# Altium project DTCP v2.0.PrjPcb (part 2 of 2)

## Sheet Boost 5V.SchDoc
size A; SheetNumber: 12; SheetTotal: 12
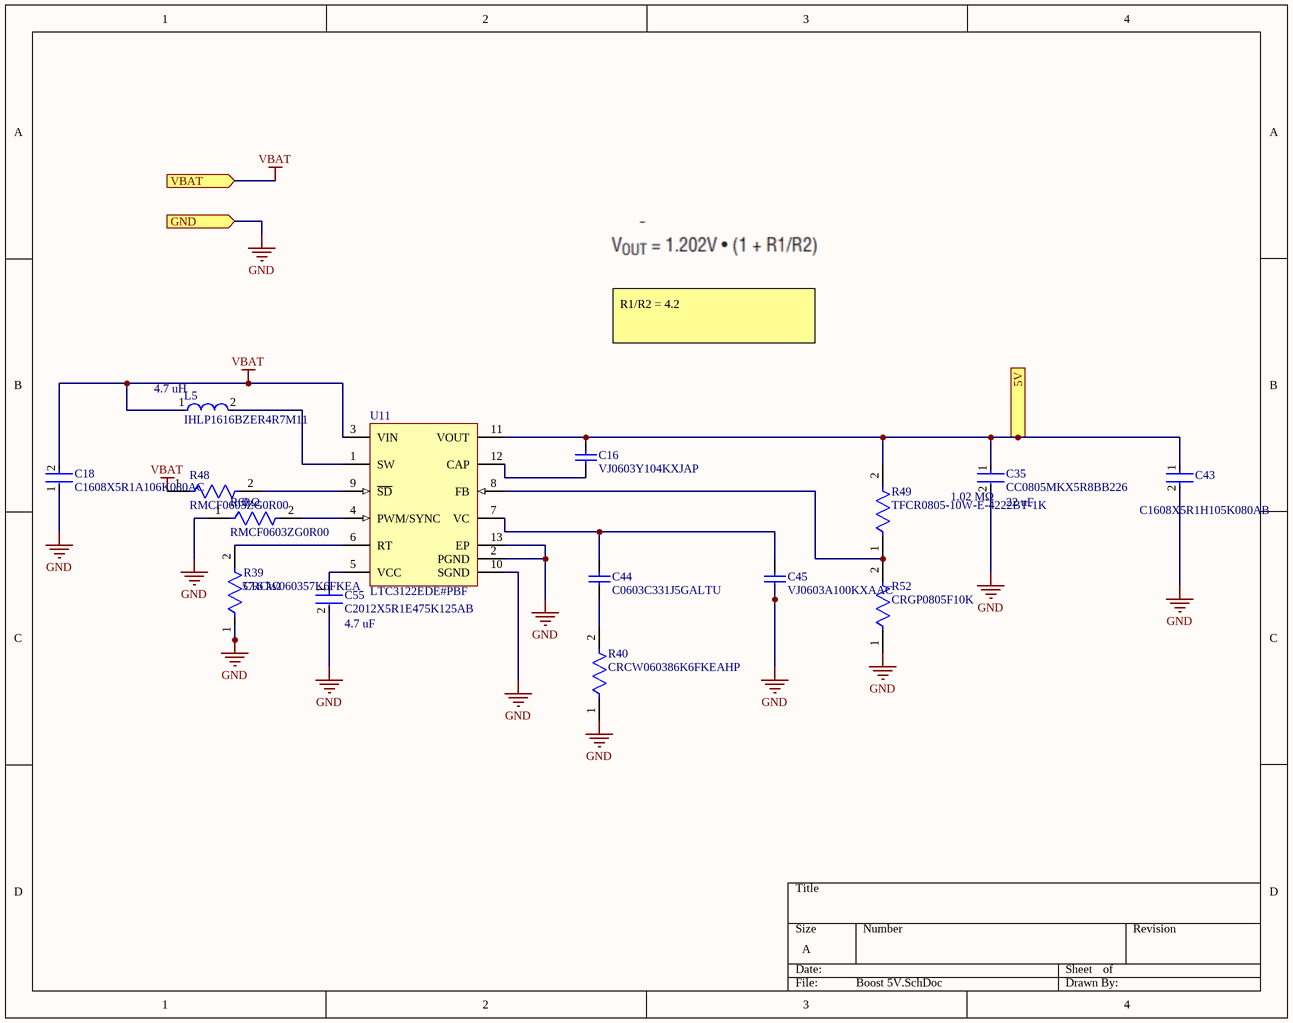
[diagram p10: Boost 5V.SchDoc]

### Parts
C16  VJ0603Y104KXJAP  [CAPC1608X92X38NL15T08]
C18  C1608X5R1A106K080AC  [FP-C1608-080-0_1-MFG]
C35  CC0805MKX5R8BB226  [FP-CC0805-0_2-1_45-IPC_C]
C43  C1608X5R1H105K080AB  [FP-C1608-080-0_1-IPC_B]
C44  C0603C331J5GALTU  [CAPC1608X87X35NL15T15]
C45  VJ0603A100KXAAC  [CAPC1608X92X38ML12T08]
C55  C2012X5R1E475K125AB  [FP-C2012-125-0_2-MFG]
L5  IHLP1616BZER4R7M11  [FP-IHLP-1616BZ-FP_1_8545x-MFG]
R39  CRCW060357K6FKEA  [FP-CRCW0603-e3-MFG]
R40  CRCW060386K6FKEAHP  [FP-CRCW0603-HPe3-MFG]
R48  RMCF0603ZG0R00  [FP-RMCF0603-IPC_B]
R49  TFCR0805-10W-E-4222BT-1K  [FP-TFCR0805-IPC_A]
R52  CRGP0805F10K  [FP-CRGP0805-IPC_C]
R60  RMCF0603ZG0R00  [FP-RMCF0603-IPC_B]
U11  LTC3122EDE#PBF  [LT-DE-UE-12_V]

### Ports
5V (out), GND (in), VBAT (in)

### Nets
5V0: C16.2 C35.1 C43.1 R49.2 U11.11(VOUT) ; port 5V
GND: C18.1 C35.2 C43.2 C45.1 C55.2 R39.1 R40.1 R52.1 R60.1 U11.2(PGND) U11.10(SGND) U11.13(EP) ; port GND
VBAT: C18.2 L5.1 R48.1 U11.3(VIN) ; port VBAT
NetC16_1: C16.1 U11.12(CAP)
NetC44_1: C44.1 R40.2
NetC44_2: C44.2 C45.2 U11.7(VC)
NetC55_1: C55.1 U11.5(VCC)
NetL5_2: L5.2 U11.1(SW)
NetR39_2: R39.2 U11.6(RT)
NetR48_2: R48.2 U11.9(~{SD})
NetR49_1: R49.1 R52.2 U11.8(FB)
NetR60_2: R60.2 U11.4(PWM/SYNC)

### Notes on the sheet
- R1/R2 = 4.2
- (near L5) 4.7 uH
- 0 Ω
- (near C35) 1.02 MΩ
- (near C35) 22 uF
- (near R39) 57.6 kΩ
- (near C55) 4.7 uF

### Library data of the parts
C16 = CMP-2006-01211-1: Manufacturer: Vitramon; Part Number: VJ0603Y104KXJAP
C18 = CMP-2000-04979-3: Multilayer Ceramic Capacitors 10μF ±10% 10V X5R SMD 0603; Capacitance: 10uF; Dielectric Material: Ceramic; Construction: Flat; Height: 0.8mm; Thickness: 0.035inch; Case Code (Metric): 1608; Radiation Hardening: No; Number of Pins: 2; Voltage Rating (DC): 10V; Depth: 0.8mm; Voltage: 10V; RoHS Compliant: Yes; Voltage Rating: 10V; Package Quantity: 1; Resistor Type: Ceramic; Termination: SMD/SMT; Lead Free: Lead Free; REACH SVHC: No SVHC; Tolerance: 10%; Mount: Surface Mount; Series: C; Packaging: Tape and Reel; Width: 0.8mm; Dielectric: X5R; Weight: 7.1E-05oz; Length: 1.6mm; Max Operating Temperature: 85°C; Case Code (Imperial): 0603; Case/Package: 0603; Min Operating Temperature: -55°C
C35 = CMP-03422-001497-1: CAP CER 22UF 25V X5R 0805; Tolerance: 20%; Max Operating Temperature: 85°C; Dielectric: X5R; Termination: SMD/SMT; Voltage Rating: 25V; Width: 0.049inch; Min Operating Temperature: -55°C; Case/Package: 0805; Lead Free: Lead Free; RoHS Compliant: Yes; Weight: 0.000194oz; Voltage Rating (DC): 25V; Capacitance: 22uF; Length: 0.079inch; Halogen Free: Halogen Free; Height: 1.25mm; Packaging: Tape and Reel; Package Quantity: 3000; Case Code (Metric): 2012; Thickness: 0.057inch; Case Code (Imperial): 0805; Mount: Surface Mount
C43 = CMP-2000-06025-2: Multilayer Ceramic Capacitors 1μF ±10% 50V X5R SMD 0603; Capacitance: 1uF; Lead Free: Lead Free; Height: 0.8mm; Mount: Surface Mount; Radiation Hardening: No; Thickness: 0.035inch; Length: 1.6mm; Max Operating Temperature: 85°C; REACH SVHC: No SVHC; Min Operating Temperature: -55°C; Construction: Flat; RoHS Compliant: Yes; Voltage Rating: 50V; Dielectric: X5R; Packaging: Tape and Reel; Termination: SMD/SMT; Voltage Rating (DC): 50V; Case Code (Imperial): 0603; Voltage: 50V; Width: 0.031inch; Weight: 7.1E-05oz; Depth: 0.8mm; Case Code (Metric): 1608; Series: C; Case/Package: 0603; Tolerance: 10%; Resistor Type: Ceramic; Number of Pins: 2; Dielectric Material: Ceramic; Package Quantity: 1
C44 = CMP-2006-03564-1: Manufacturer: Kemet; Part Number: C0603C331J5GALTU
C45 = CMP-2006-02012-1: Manufacturer: Vitramon; Part Number: VJ0603A100KXAAC
C55 = CMP-08246-004908-1: Multilayer Ceramic Capacitors 4.7μF ±10% 25V X5R SMD 0805; Capacitance: 4.7uF; Lead Free: Lead Free; Thickness: 0.057inch; Packaging: Tape and Reel; Min Operating Temperature: -55°C; RoHS Compliant: Yes; Dielectric: X5R; Weight: 0.000194oz; REACH SVHC: No SVHC; Voltage Rating (DC): 25V; Mount: Surface Mount; Resistor Type: Ceramic; Termination: SMD/SMT; Number of Pins: 2; Case Code (Imperial): 0805; Dielectric Material: Ceramic; Voltage: 25V; Voltage Rating: 25V; Case Code (Metric): 2012; Case/Package: 0805; Max Operating Temperature: 85°C; Height: 1.25mm; Tolerance: 10%; Depth: 1.25mm; Package Quantity: 1; Length: 2mm; Radiation Hardening: No; Width: 1.25mm
L5 = CMP-02424-000576-1: Fixed Inductors Commercial Low DCR Series SMT 4.7uH 1.7A 105mΩ 20%; Saturation Current: 1.75A; Test Frequency: 100kHz; Shielding: Shielded; Self Resonant Frequency: 29MHz; Core Material: Ferrite; DC Resistance (DCR): 105mR; Width: 4.06mm; Depth: 4.31mm; Height: 2mm; Inductance: 4.7uH; Case/Package: 1616; Max DC Current: 1.7A; Max Operating Temperature: 125°C; Inductance Tolerance: 20%; Current Rating: 1.7A; Package Quantity: 4000; Tolerance: 20%; Length: 4.7mm; Contact Plating: Tin; RMS Current (Irms): 1.7A; Packaging: Tape and Reel; Height - Seated (Max): 0.079inch; Military Standard: Not; Termination: SMD/SMT; Mount: Surface Mount; Number of Pins: 1616; Min Operating Temperature: -55°C; Lead Free: Lead Free; Radiation Hardening: No
R39 = CMP-2000-03475-2: RES Thick Film, 57.6kΩ, 1%, 0.1W, 100ppm/°C, 0603; Voltage Rating: 75V; Power Rating: 100mW; Resistance: 57.6kR; Case Code (Metric): 1608; Length: 1.55mm; Weight: 7.1E-05oz; Case/Package: 0603; Features: Automotive AEC-Q200; Contact Plating: Tin; Temperature Coefficient: 100ppm/°C; Number of Terminations: 2; Packaging: Tape and Reel; Package Quantity: 10; Max Power Dissipation: 100mW; Depth: 0.85mm; Height: 0.45mm; Tolerance: 1%; Radiation Hardening: No; Composition: Thick Film; Width: 0.85mm; Min Operating Temperature: -55°C; Case Code (Imperial): 0603; Termination: SMD/SMT; Number of Pins: 2; Max Operating Temperature: 155°C; Military Standard: Not
R40 = CMP-02407-006337-1: RES Thick Film, 86.6kΩ, 1%, 0.33W, 100ppm/°C, 0603; Max Power Dissipation: 250mW; Resistance: 86.6kR; Tolerance: 1%; Width: 0.033inch; Package Quantity: 5000; Composition: Thick Film; Number of Terminations: 2; Height: 0.022inch; Length: 0.063inch; Temperature Coefficient: 100ppm/°C; Packaging: Tape and Reel; Features: Automotive AEC-Q200; Lead Free: Lead Free; Case/Package: 0603
R48 R60 = CMP-26527-006412-1: 0Ω ±0 0.1W 0603 Thick Film Chip Resistor AEC-Q200 compliant; Max Power Dissipation: 100mW; Resistance: 0R; Width: 0.031inch; RoHS Compliant: Yes; Number of Terminations: 2; Case/Package: 0603; Contact Plating: Tin; Height: 0.022inch; Resistor Type: Thick Film; Mount: Surface Mount; Length: 0.061inch; Features: Automotive AEC-Q200; Series: RMCF; Max Operating Temperature: 155°C; Radiation Hardening: No; Min Operating Temperature: -55°C; Packaging: Tape and Reel
R49 = CMP-250906-237835-1: RES Thin Film,  42.2kΩ, 0.1%, 0.1W, 25ppm/°C, 0805
R52 = CMP-03211-006861-1: CRGP 0805 10K 1%; Manufacturer: TE; Power Rating: 0.33W; Voltage Rating: 150V; Value: 10KΩ; Tolerance: 0.01; Temperature Coefficient: ±100ppm/°C; Manufacturer Part Number: CRGP0805F10K; ComponentLink2URL: https://www.mouser.com/datasheet/2/418/NG_DS_9-1773463-9_A-1358566.pdf; Temperature Range Low: -55°C; Ipc Land Pattern Name: RESC200125X55; Device Class L2: Resistors; Automotive: No; Device Class L3: Chip SMD Resistors; Composition: Thick Film; Temperature Range High: +155°C; Temperature: -55°C to +155°C; Height: 0.65mm; Series: CRGP; RoHS: TRUE; Device Class L1: Passive Components; Octopart: https://octopart.com/crgp0805f10k-te+connectivity-91018782; Package: CRGP0805; Digikey Description: CRGP 0805 10K 1%; Ambient Temperature Range High: +70°C; Lead Free: Yes; ComponentLink2Description: Datasheet; Category: Res; Resistance: 10KΩ
U11 = CMP-0492-00369-1: 2.5 A Synchronous Step-Up DC/DC Converter with Output Disconnect, 12-pin SON (DE-UE-12), -40 to 125 degC, Pb-Free; Manufacturer: Linear Technology; Number of Outputs: 1; ComponentLink2URL: http://cds.linear.com/docs/en/datasheet/3122fa.pdf; ComponentLink1URL: http://www.linear.com/; Code_JEDEC: MO-229; ComponentLink2Description: Datasheet; ComponentLink1Description: Manufacturer URL; PackageReference: DE-UE-12; PackageVersion: Rev. D, 06/2010; ComponentLink3Description: Package Specification; PackageDescription: 12-Pin Plastic DFN, Body 4 x 3 mm, Pitch 0.5 mm; PartNumber: LTC3122EDE#PBF; ComponentLink3URL: http://cds.linear.com/docs/en/packaging/DFN_12_05-08-1695.pdf; Mounting Technology: Surface Mount; RoHS: TRUE; DatasheetVersion: Rev. A

## Sheet AFE.SchDoc
size A; SheetNumber: 7; SheetTotal: 12
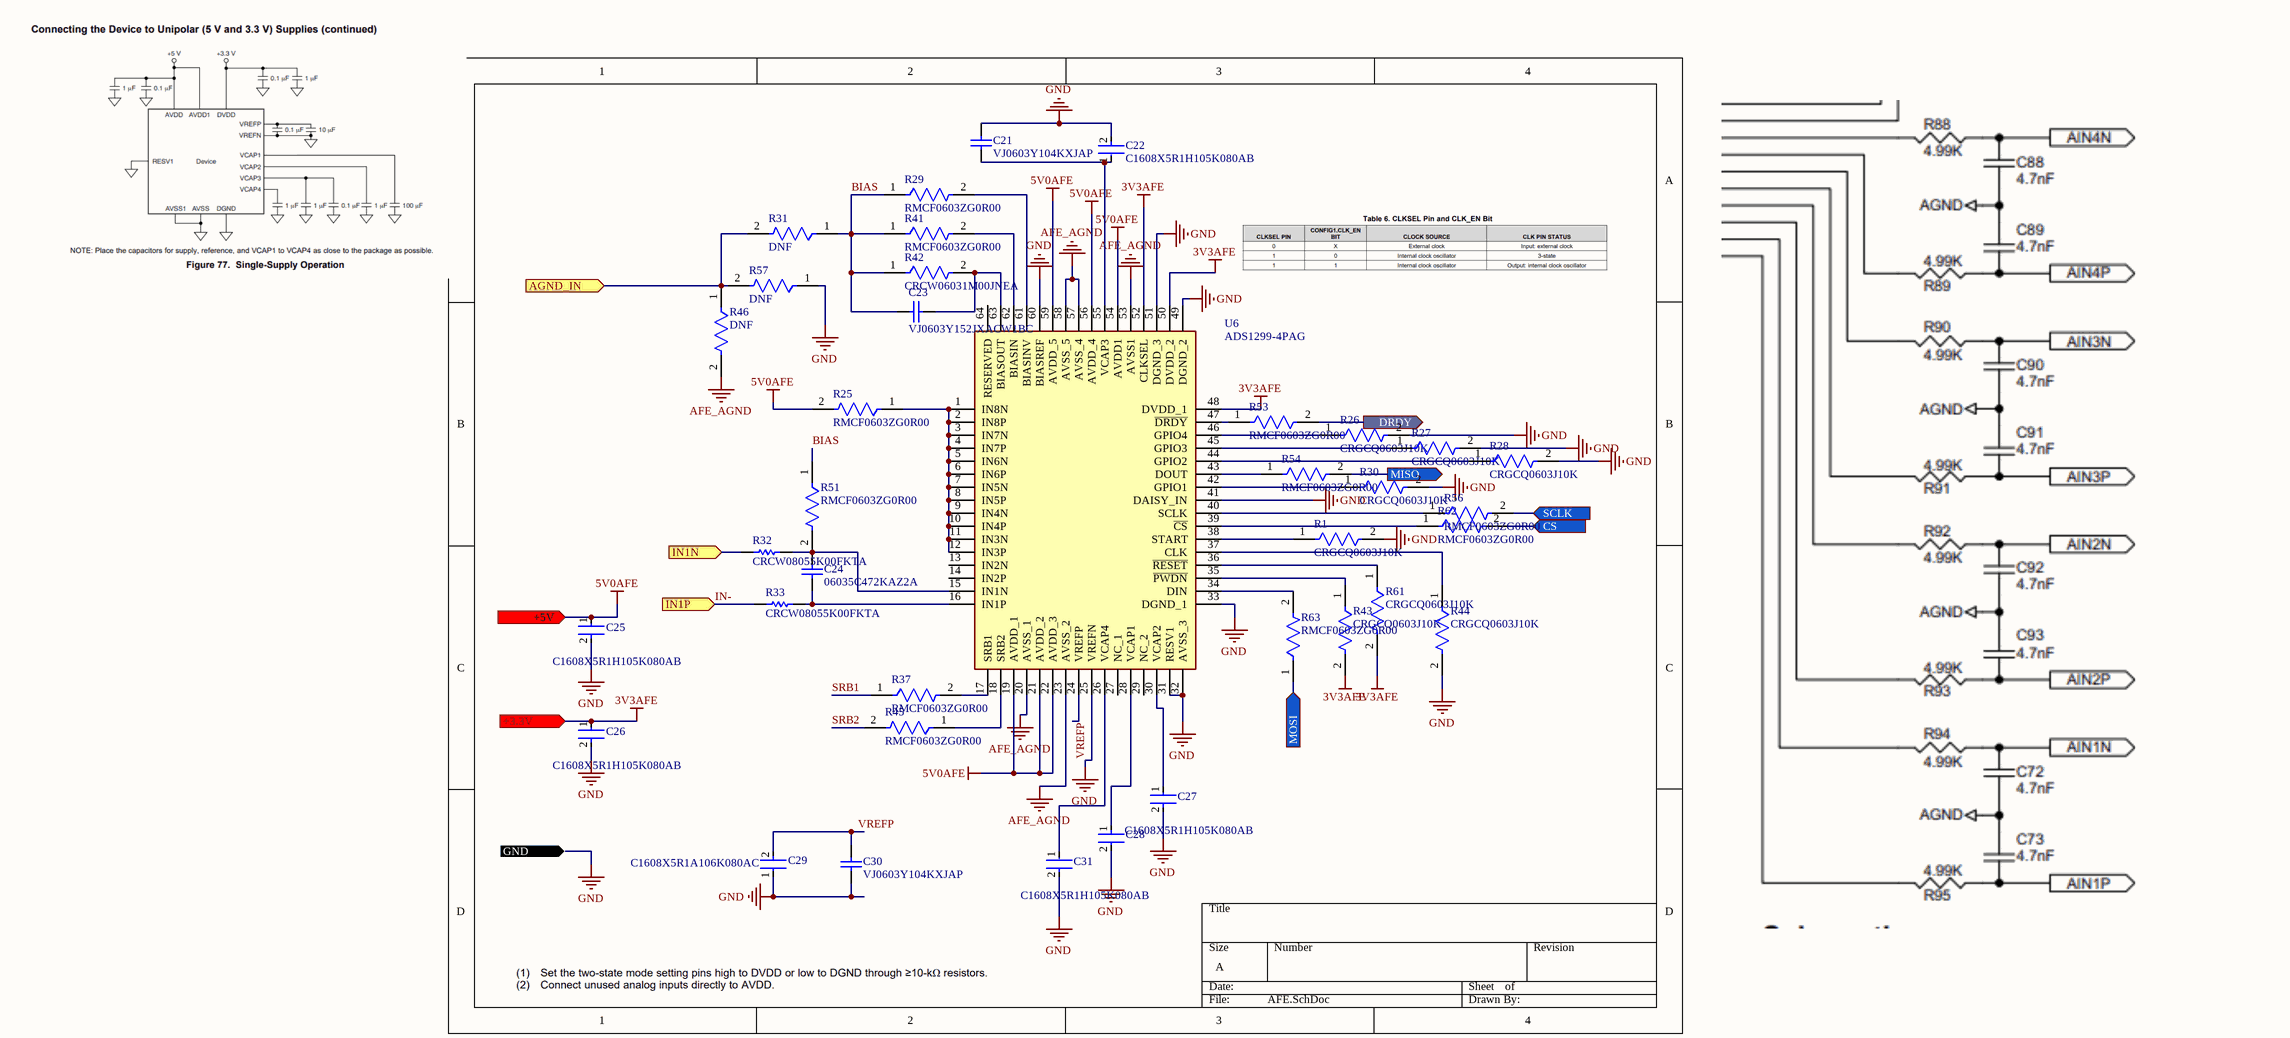
[diagram p11: AFE.SchDoc]

### Parts
C21  VJ0603Y104KXJAP  [CAPC1608X92X38NL15T08]
C22  C1608X5R1H105K080AB  [FP-C1608-080-0_1-IPC_B]
C23  VJ0603Y152JXACW1BC  [CAPC1608X95X40NL15T15]
C24  06035C472KAZ2A  [CAPC1608X90X35LL15T15]
C25  C1608X5R1H105K080AB  [FP-C1608-080-0_1-IPC_B]
C26  C1608X5R1H105K080AB  [FP-C1608-080-0_1-IPC_B]
C27  C1608X5R1H105K080AB  [FP-C1608-080-0_1-IPC_B]
C28  GRM21BR60J107ME15K  [FP-GRM21B-0_2-e0_2_0_7-IPC_B]  (value not drawn)
C29  C1608X5R1A106K080AC  [FP-C1608-080-0_1-MFG]
C30  VJ0603Y104KXJAP  [CAPC1608X92X38NL15T08]
C31  C1608X5R1H105K080AB  [FP-C1608-080-0_1-IPC_B]
R1  CRGCQ0603J10K  [FP-CRGCQ0603-IPC_C]
R25  RMCF0603ZG0R00  [FP-RMCF0603-IPC_B]
R26  CRGCQ0603J10K  [FP-CRGCQ0603-IPC_C]
R27  CRGCQ0603J10K  [FP-CRGCQ0603-IPC_C]
R28  CRGCQ0603J10K  [FP-CRGCQ0603-IPC_C]
R29  RMCF0603ZG0R00  [FP-RMCF0603-IPC_B]
R30  CRGCQ0603J10K  [FP-CRGCQ0603-IPC_C]
R31  DNF  [FP-RMCF0603-IPC_B]
R32  CRCW08055K00FKTA  [RESC2013X50X30ML20T20]
R33  CRCW08055K00FKTA  [RESC2013X50X30ML20T20]
R37  RMCF0603ZG0R00  [FP-RMCF0603-IPC_B]
R41  RMCF0603ZG0R00  [FP-RMCF0603-IPC_B]
R42  CRCW06031M00JNEA  [FP-CRCW0603-e3-IPC_B]
R43  CRGCQ0603J10K  [FP-CRGCQ0603-IPC_C]
R44  CRGCQ0603J10K  [FP-CRGCQ0603-IPC_C]
R45  RMCF0603ZG0R00  [FP-RMCF0603-IPC_B]
R46  DNF  [FP-RMCF0603-IPC_B]
R51  RMCF0603ZG0R00  [FP-RMCF0603-IPC_B]
R53  RMCF0603ZG0R00  [FP-RMCF0603-IPC_B]
R54  RMCF0603ZG0R00  [FP-RMCF0603-IPC_B]
R56  RMCF0603ZG0R00  [FP-RMCF0603-IPC_B]
R57  DNF  [FP-RMCF0603-IPC_B]
R61  CRGCQ0603J10K  [FP-CRGCQ0603-IPC_C]
R62  RMCF0603ZG0R00  [FP-RMCF0603-IPC_B]
R63  RMCF0603ZG0R00  [FP-RMCF0603-IPC_B]
U6  ADS1299-4PAG  [QFP50P1200X1200X120-64N]

### Ports
+3.3V (in), +5V (in), AGND_IN (in), CS (in), DRDY (out), GND (in), IN1N (in), IN1P (in), MISO (out), MOSI (in), SCLK (in)

### Nets
3V3AFE: C26.1 R43.2 R61.2 U6.48(DVDD_1) U6.50(DVDD_2) U6.52(CLKSEL) ; port +3.3V  [project net 3V3]
5V0AFE: C25.1 R25.2 U6.19(AVDD_1) U6.21(AVDD_2) U6.22(AVDD_3) U6.54(AVDD1) U6.56(AVDD_4) U6.59(AVDD_5) ; port +5V  [project net 5V0]
AFE_AGND: R46.2 U6.20(AVSS_1) U6.23(AVSS_2) U6.53(AVSS1) U6.57(AVSS_4) U6.58(AVSS_5)
GND: C21.2 C22.2 C25.2 C26.2 C27.2 C28.2 C29.1 C30.1 C31.2 R1.2 R26.2 R27.2 R28.2 R30.2 R44.2 R57.1 U6.25(VREFN) U6.31(RESV1) U6.32(AVSS_3) U6.33(DGND_1) U6.41(DAISY_IN) U6.49(DGND_2) U6.51(DGND_3) U6.60(BIASREF) ; port GND
BIAS: C23.1 R29.1 R31.1 R41.1 R42.1 R51.1
CS: R62.2 ; port CS
DRDY: R53.2 ; port DRDY
IN-: R33.1 ; port IN1P
PICO: R63.1 ; port MOSI
POCI: R54.2 ; port MISO
SCK: R56.2 ; port SCLK
SRB1: R37.1
SRB2: R45.2
VREFP: C29.2 C30.2 U6.24(VREFP)
NetC21_1: C21.1 C22.1 U6.55(VCAP3)
NetC23_2: C23.2 R42.2 U6.63(BIASOUT)
NetC24_1: C24.1 R32.2 R51.2 U6.15(IN1N)
NetC24_2: C24.2 R33.2 U6.16(IN1P)
NetC27_1: C27.1 U6.30(VCAP2)
NetC28_1: C28.1 U6.28(VCAP1)
NetC31_1: C31.1 U6.26(VCAP4)
NetP1_2: R32.1 ; port IN1N
NetP3_1: R31.2 R46.1 R57.2 ; port AGND_IN
NetR1_1: R1.1 U6.38(START)
NetR25_1: R25.1 U6.1(IN8N) U6.2(IN8P) U6.3(IN7N) U6.4(IN7P) U6.5(IN6N) U6.6(IN6P) U6.7(IN5N) U6.8(IN5P) U6.9(IN4N) U6.10(IN4P) U6.11(IN3N) U6.12(IN3P)
NetR26_1: R26.1 U6.46(GPIO4)
NetR27_1: R27.1 U6.45(GPIO3)
NetR28_1: R28.1 U6.44(GPIO2)
NetR29_2: R29.2 U6.61(BIASINV)
NetR30_1: R30.1 U6.42(GPIO1)
NetR37_2: R37.2 U6.17(SRB1)
NetR41_2: R41.2 U6.62(BIASIN)
NetR43_1: R43.1 U6.35(~{PWDN})
NetR44_1: R44.1 U6.37(CLK)
NetR45_1: R45.1 U6.18(SRB2)
NetR53_1: R53.1 U6.47(~{DRDY})
NetR54_1: R54.1 U6.43(DOUT)
NetR56_1: R56.1 U6.40(SCLK)
NetR61_1: R61.1 U6.36(~{RESET})
NetR62_1: R62.1 U6.39(~{CS})
NetR63_2: R63.2 U6.34(DIN)

Not connected (* = marked no-connect by the designer): U6 13(IN2N) 14(IN2P) 27(NC_1) 29(NC_2) 64(RESERVED)

### Library data of the parts
C21 C30 = CMP-2006-01211-1: Manufacturer: Vitramon; Part Number: VJ0603Y104KXJAP
C22 C25-C27 C31 = CMP-2000-06025-2: as C43 on sheet Boost 5V; Lead Free: Lead Free; Height: 0.8mm; Mount: Surface Mount; Radiation Hardening: No; Thickness: 0.035inch; Length: 1.6mm; Max Operating Temperature: 85°C; REACH SVHC: No SVHC; Min Operating Temperature: -55°C; Construction: Flat; RoHS Compliant: Yes; Voltage Rating: 50V; Dielectric: X5R; Packaging: Tape and Reel; Termination: SMD/SMT; Voltage Rating (DC): 50V; Case Code (Imperial): 0603; Voltage: 50V; Width: 0.031inch; Weight: 7.1E-05oz; Depth: 0.8mm; Case Code (Metric): 1608; Series: C; Case/Package: 0603; Tolerance: 10%; Resistor Type: Ceramic; Number of Pins: 2; Dielectric Material: Ceramic; Package Quantity: 1
C23 = CMP-2006-01561-1: Manufacturer: Vitramon; Part Number: VJ0603Y152JXACW1BC
C24 = CMP-2006-04440-1: Manufacturer: AVX Interconnect / Elco; Part Number: 06035C472KAZ2A
C28 = CMP-06035-052658-1: Chip Multilayer Ceramic Capacitors for General Purpose, 0805, 100uF, X5R, 15%, 20%, 6.3V; Voltage Rating (DC): 6.3V; Lead Free: Lead Free; Length: 2mm; Tolerance: 20%; Width: 1.25mm; Capacitance: 100uF; Dielectric: X5R; Thickness: 1.25mm
C29 = CMP-2000-04979-3: as C18 on sheet Boost 5V; Dielectric Material: Ceramic; Construction: Flat; Height: 0.8mm; Thickness: 0.035inch; Case Code (Metric): 1608; Radiation Hardening: No; Number of Pins: 2; Voltage Rating (DC): 10V; Depth: 0.8mm; Voltage: 10V; RoHS Compliant: Yes; Voltage Rating: 10V; Package Quantity: 1; Resistor Type: Ceramic; Termination: SMD/SMT; Lead Free: Lead Free; REACH SVHC: No SVHC; Tolerance: 10%; Mount: Surface Mount; Series: C; Packaging: Tape and Reel; Width: 0.8mm; Dielectric: X5R; Weight: 7.1E-05oz; Length: 1.6mm; Max Operating Temperature: 85°C; Case Code (Imperial): 0603; Case/Package: 0603; Min Operating Temperature: -55°C
R1 R26-R28 R30 R43 R44 R61 = CMP-03211-009884-1: CRGCQ 0603 10K 5%; Manufacturer: TE Connectivity; Tolerance: 0.05; Power Rating: 0.1W; Resistance: 10KΩ; Voltage Rating: 75V; Value: 10KΩ; Temperature Coefficient: ±100ppm/°C; Composition: Thick Film; ComponentLink2URL: https://www.te.com/commerce/DocumentDelivery/DDEController?Action=showdoc&DocId=Data+Sheet%7F1773204-3%7F1%7Fpdf%7FEnglish%7FENG_DS_1773204-3_1.pdf%7F4-2176339-923; Device Class L1: Passive Components; Package: CRGCQ0603; Mouser Description: Res Thick Film 0603 10K Ohm 5% 0.1W(1/10W) ±100ppm/C Pad SMD Automotive T/R; Temperature Range High: +155°C; Category: Res; Device Class L2: Resistors; Height: 0.55mm; RoHS: TRUE; Lead Free: Yes; Ipc Land Pattern Name: RESC16080X45; Temperature: -55°C to +155°C; Series: CRGCQ; Digikey Description: CRGCQ 0603 10K 5%; Octopart: https://octopart.com/crgcq0603j10k-te+connectivity-91018097; Device Class L3: Chip SMD Resistors; Ambient Temperature Range High: +70°C; ComponentLink2Description: Datasheet; Temperature Range Low: -55°C; Manufacturer Part Number: CRGCQ0603J10K
R25 R29 R31 R37 R41 R45 R46 R51 R53 R54 R56 R57 R62 R63 = CMP-26527-006412-1: as R48 on sheet Boost 5V; Width: 0.031inch; RoHS Compliant: Yes; Number of Terminations: 2; Case/Package: 0603; Contact Plating: Tin; Height: 0.022inch; Resistor Type: Thick Film; Mount: Surface Mount; Length: 0.061inch; Features: Automotive AEC-Q200; Series: RMCF; Max Operating Temperature: 155°C; Radiation Hardening: No; Min Operating Temperature: -55°C; Packaging: Tape and Reel
R32 R33 = CMP-2001-04239-1: Manufacturer: Vishay Dale; Part Number: CRCW08055K00FKTA
R42 = CMP-2000-03016-2: RES Thick Film, 1MΩ, 5%, 0.1W, 200ppm/°C, 0603; Max Power Dissipation: 100mW; Resistance: 1MR; Voltage Rating: 75V; Temperature Coefficient: 200ppm/°C; Military Standard: Not; Mount: Surface Mount; Package Quantity: 1; Number of Pins: 2; Power Rating: 100mW; Packaging: Tape and Reel; Length: 1.55mm; Width: 0.85mm; Height: 0.02inch; Min Operating Temperature: -55°C; Tolerance: 5%; Depth: 0.85mm; Composition: Thick Film; Number of Terminations: 2; Max Operating Temperature: 155°C; Termination: SMD/SMT; Case Code (Imperial): 0603; Weight: 7.1E-05oz; Case Code (Metric): 1608; Radiation Hardening: No; Contact Plating: Tin; Case/Package: 0603; Features: Automotive AEC-Q200
U6 = ADS1299-4PAG: Low-Noise, 4-Channel, 24-Bit Analog-to-Digital Converter for Biopotential Measurements; Manufacturer_Name: Texas Instruments; Geometry.Height: 1.2mm; Mouser Part Number: 595-ADS1299-4PAG; Mouser Price/Stock: https://www.mouser.co.uk/ProductDetail/Texas-Instruments/ADS1299-4PAG?qs=9lcNTSmDlCovTG3JfbaYgg%3D%3D; Manufacturer_Part_Number: ADS1299-4PAG; Datasheet Link: http://www.ti.com/lit/gpn/ads1299-4

## Nets that join several sheets
3V3: System (J2.9 R12.2), MCU (5 pins), DDS (Y1.4), LDO (C20.2 U5.1 U5.2), Switch1 (C11.2 U3.1), AFE (6 pins)
3V3DDS: System (R12.1), DDS (10 pins), Switch1 (U3.6)
5V0: System (J2.8), Boost 5V (5 pins), AFE (8 pins)
13V0: System (J2.7 R11.2), Boost 12V (5 pins), Switch2 (C47.2 U10.1)
13V0PA: System (R8.1), PA stage 2 (C36.2 C38.2 L3.2)
GND: System (44 pins), MCU (5 pins), DDS (17 pins), PA stage 1 (5 pins), PA stage 2 (13 pins), LDO (C19.2 C20.1 U5.3 U5.7), Output (L15.2 L15.5), Boost 12V (11 pins), Switch1 (C11.1 C12.1 U3.2), Switch2 (C47.1 C48.1 U10.2), Boost 5V (12 pins), AFE (24 pins)
PA1_VDD: System (R15.1), PA stage 1 (R38.2)
VBAT: System (12 pins), LDO (C19.1 U5.5 U5.6), Boost 12V (C6.2 L1.1 R4.1 U2.3), Boost 5V (C18.2 L5.1 R48.1 U11.3)
CS: System (J8.9), MCU (U1.19), AFE (R62.2)
D7: System (J1.4), MCU (U1.20), DDS (U4.25)
DDS_OUT: System (R16.2), DDS (R21.1 U4.21), PA stage 1 (C34.1)
DDS_RST: System (J1.3), MCU (U1.13), DDS (U4.22)
DDS_WCLK: System (J1.1), MCU (U1.18), DDS (U4.7)
DRDY: System (J8.6), MCU (U1.10), AFE (R53.2)
FQ_UD: System (J1.2), MCU (U1.17), DDS (U4.8)
IN-: System (P1.1), AFE (R33.1)
NetC33_2: System (R10.2), PA stage 1 (C33.2), PA stage 2 (C39.1 L4.2)
NetC40_2: System (R13.2), PA stage 2 (C40.2), Output (L15.4)
NetL14_1: System (R9.1), Output (L14.1 L15.3 L16.2)
NetL15_1: System (R17.2), Output (L15.1 L16.1 L17.2)
NetP1_2: System (P1.2), AFE (R32.1)
NetP3_1: System (P3.1), AFE (R31.2 R46.1 R57.2)
NetR8_2: System (R8.2 R11.1 R15.2), Switch2 (U10.6)
NetR14_1: MCU (U1.3), Boost 12V (R14.1), Switch2 (U10.3)
NetU1_8: MCU (U1.8), DDS (Y1.1), Switch1 (U3.3)
NRST: System (J2.4), MCU (R2.1 U1.5)
PICO: System (J8.10), MCU (U1.14), AFE (R63.1)
POCI: System (J8.7), MCU (U1.12), AFE (R54.2)
SCK: System (J8.8), MCU (U1.11), AFE (R56.2)
SWCLK: System (J2.5), MCU (U1.16)
SWDIO: System (J2.6), MCU (U1.15)
TXD: System (J1.6), MCU (U1.2)
UART_Rx: System (J1.5), MCU (U1.1)